# Altium schematic sheet Verici_Karti_Blok_Diyagram.SchDoc
size A4; SheetNumber: 1; SheetTotal: 6
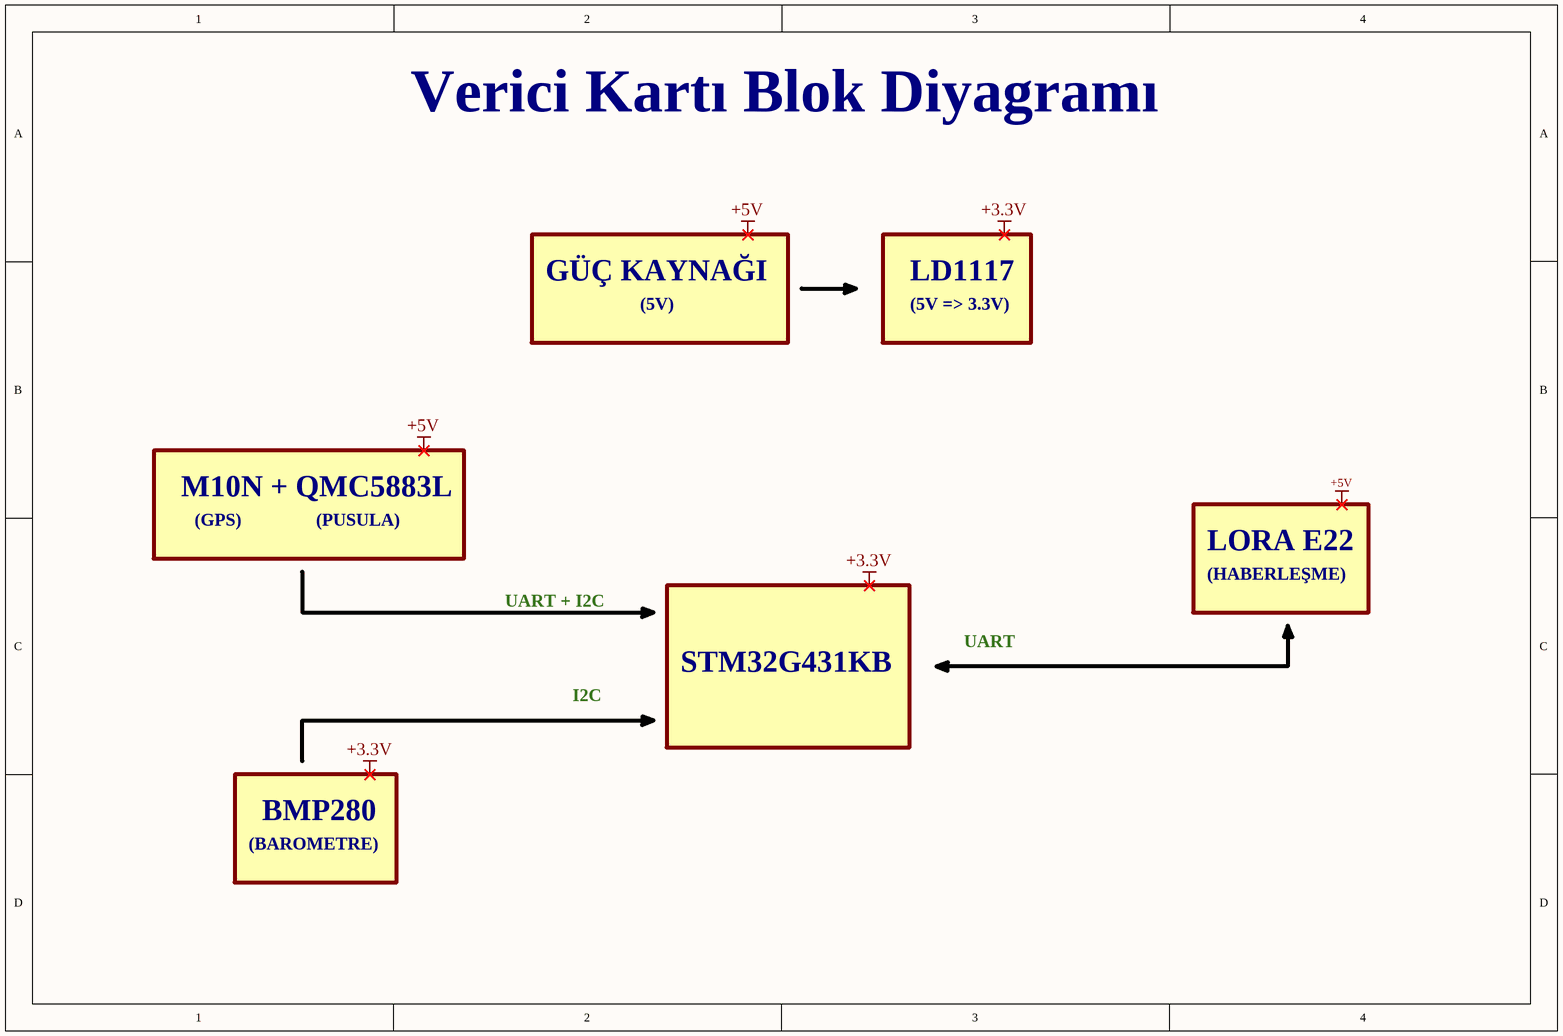
[diagram p0: Verici_Karti_Blok_Diyagram.SchDoc]

## Notes on the sheet
- Verici Kartı Blok Diyagramı
- GÜÇ KAYNAĞI
- (5V)
- LD1117
- (5V => 3.3V)
- M10N + QMC5883L
- (GPS)
- (PUSULA)
- LORA E22
- (HABERLEŞME)
- UART + I2C
- UART
- I2C
- STM32G431KB
- (BAROMETRE)
- BMP280
- Labels drawn without touching a wire or pin: +3.3V, +5V